# Altium schematic sheet Sensor.SchDoc
size A4
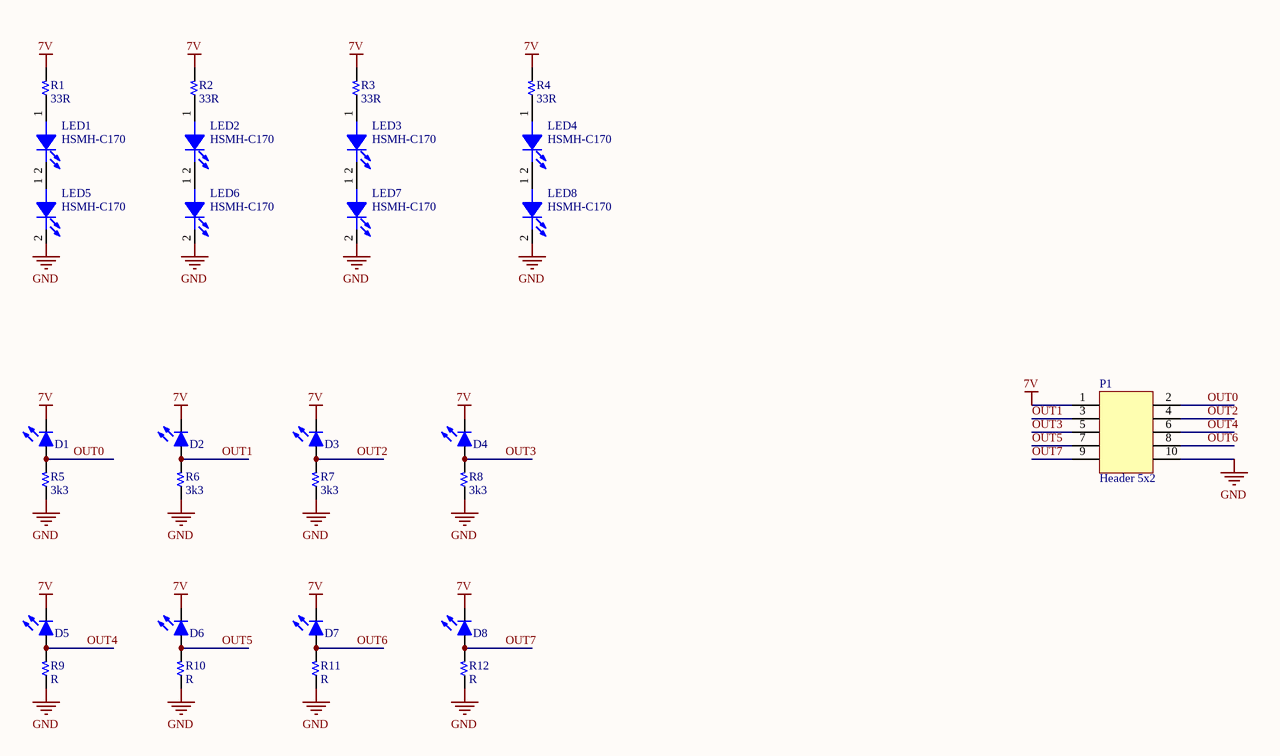
[diagram p0: Sensor.SchDoc]

## Parts
D1  Led  [LED1206]  (value not drawn)
D2  Led  [LED1206]  (value not drawn)
D3  Led  [LED1206]  (value not drawn)
D4  Led  [LED1206]  (value not drawn)
D5  Led  [LED1206]  (value not drawn)
D6  Led  [LED1206]  (value not drawn)
D7  Led  [LED1206]  (value not drawn)
D8  Led  [LED1206]  (value not drawn)
LED1  HSMH-C170  [LED5730]
LED2  HSMH-C170  [LED5730]
LED3  HSMH-C170  [LED5730]
LED4  HSMH-C170  [LED5730]
LED5  HSMH-C170  [LED5730]
LED6  HSMH-C170  [LED5730]
LED7  HSMH-C170  [LED5730]
LED8  HSMH-C170  [LED5730]
P1  Header 5x2  [Header 5x2N]
R1  33R  [R 0805]
R2  33R  [R 0805]
R3  33R  [R 0805]
R4  33R  [R 0805]
R5  3k3  [R 0805]
R6  3k3  [R 0805]
R7  3k3  [R 0805]
R8  3k3  [R 0805]
R9  R  [R 0805]
R10  R  [R 0805]
R11  R  [R 0805]
R12  R  [R 0805]

## Nets
7V: D1.2(K) D2.2(K) D3.2(K) D4.2(K) D5.2(K) D6.2(K) D7.2(K) D8.2(K) P1.1 R1.2 R2.2 R3.2 R4.2
GND: LED5.2(K) LED6.2(K) LED7.2(K) LED8.2(K) P1.10 R5.1 R6.1 R7.1 R8.1 R9.1 R10.1 R11.1 R12.1
OUT0: D1.1(A) P1.2 R5.2
OUT1: D2.1(A) P1.3 R6.2
OUT2: D3.1(A) P1.4 R7.2
OUT3: D4.1(A) P1.5 R8.2
OUT4: D5.1(A) P1.6 R9.2
OUT5: D6.1(A) P1.7 R10.2
OUT6: D7.1(A) P1.8 R11.2
OUT7: D8.1(A) P1.9 R12.2
NetLED1_1: LED1.1(A) R1.1
NetLED1_2: LED1.2(K) LED5.1(A)
NetLED2_1: LED2.1(A) R2.1
NetLED2_2: LED2.2(K) LED6.1(A)
NetLED3_1: LED3.1(A) R3.1
NetLED3_2: LED3.2(K) LED7.1(A)
NetLED4_1: LED4.1(A) R4.1
NetLED4_2: LED4.2(K) LED8.1(A)

## Library data of the parts
D1-D8 = Led: Typical LED
LED1-LED8 = LED_1: Typical GaAs SMD LED; Manufacturer: Lite-On Inc; Color: RED; Type: Cong ty RP; Vendor: Digikey; Publisher: Hoang Nguyen; Price: *; Published: 13-April-2009; ComponentLink1Description: Digikey Part Link; ComponentLink2Description: Open Datasheet; ComponentLink2URL: H:\LIBRARY\LIBRARY.Datasheet\
R1-R12 = Resistor